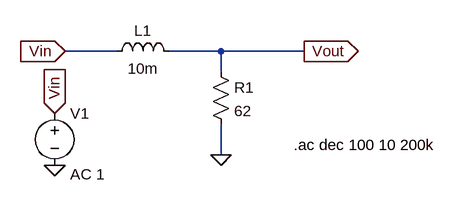
[diagram p0: schematic rl_lowpass.asc]
rl_lowpass.asc, the LTspice schematic file:
Version 4.1
SHEET 1 880 680
WIRE 144 112 64 112
WIRE 304 112 224 112
WIRE 432 112 304 112
WIRE 304 144 304 112
WIRE 304 272 304 224
FLAG 64 112 Vin
IOPIN 64 112 In
FLAG 432 112 Vout
IOPIN 432 112 Out
FLAG 304 272 0
FLAG 48 288 0
FLAG 48 208 Vin
IOPIN 48 208 In
SYMBOL res 288 128 R0
SYMATTR InstName R1
SYMATTR Value 62
SYMBOL ind 128 128 R270
WINDOW 0 32 56 VTop 2
WINDOW 3 5 56 VBottom 2
SYMATTR InstName L1
SYMATTR Value 10m
SYMATTR SpiceLine Rser=1m
SYMBOL voltage 48 192 R0
WINDOW 123 24 110 Left 2
WINDOW 39 0 0 Left 0
SYMATTR Value2 AC 1
SYMATTR InstName V1
SYMATTR Value ""
TEXT 416 256 Left 2 !.ac dec 100 10 200k

The netlist it stands for:
* rl_lowpass.asc
R1 Vout 0 62
L1 Vin Vout 10m Rser=1m
V1 Vin 0 AC 1
.ac dec 100 10 200k
.backanno
.end

* Results of the author's LTspice run, read from the files saved beside the schematic
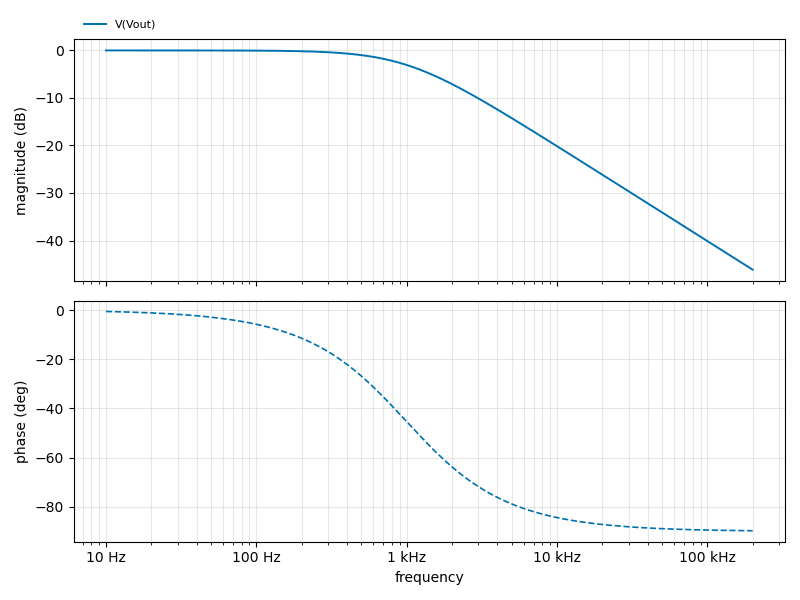
[diagram p1: AC Analysis of rl_lowpass.asc, plotted from the saved traces]
* AC Analysis, 1 run:
*   V(Vout): -0.00 dB at 10 Hz, -46.14 dB at 200 kHz, peak -0.00 dB at 10 Hz, 3 dB below the peak at 986.8 Hz